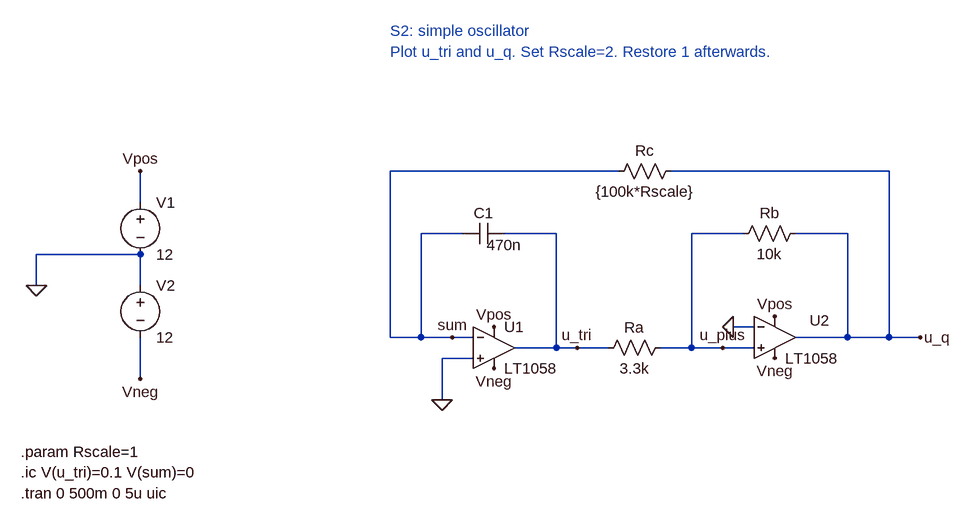
[diagram p0: schematic 6.1_oscillator.asc]
6.1_oscillator.asc, the LTspice schematic file:
Version 4.1
SHEET 1 2020 788
WIRE 768 16 416 16
WIRE 1184 16 848 16
WIRE 32 64 32 16
WIRE 528 112 464 112
WIRE 672 112 592 112
WIRE 960 112 880 112
WIRE 1120 112 1040 112
WIRE 32 144 -128 144
WIRE -128 192 -128 144
WIRE 32 192 32 144
WIRE 976 256 944 256
WIRE 416 272 416 16
WIRE 464 272 464 112
WIRE 464 272 416 272
WIRE 512 272 464 272
WIRE 544 272 512 272
WIRE 1120 272 1120 112
WIRE 1120 272 1040 272
WIRE 1184 272 1184 16
WIRE 1184 272 1120 272
WIRE 1232 272 1184 272
WIRE 672 288 672 112
WIRE 672 288 608 288
WIRE 704 288 672 288
WIRE 752 288 704 288
WIRE 880 288 880 112
WIRE 880 288 832 288
WIRE 928 288 880 288
WIRE 976 288 928 288
WIRE 544 304 496 304
WIRE 32 336 32 272
WIRE 496 368 496 304
FLAG -128 192 0
FLAG 32 16 Vpos
FLAG 32 336 Vneg
FLAG 576 256 Vpos
FLAG 576 320 Vneg
FLAG 496 368 0
FLAG 944 256 0
FLAG 1008 240 Vpos
FLAG 1008 304 Vneg
FLAG 1232 272 u_q
FLAG 704 288 u_tri
FLAG 512 272 sum
FLAG 928 288 u_plus
SYMBOL voltage 32 48 R0
WINDOW 123 0 0 Left 0
WINDOW 39 0 0 Left 0
SYMATTR InstName V1
SYMATTR Value 12
SYMBOL voltage 32 176 R0
SYMATTR InstName V2
SYMATTR Value 12
SYMBOL OpAmps\\LT1058 576 224 R0
SYMATTR InstName U1
SYMBOL OpAmps\\LT1058 1008 208 R0
WINDOW 0 54 38 Left 2
SYMATTR InstName U2
SYMBOL cap 592 96 R90
WINDOW 0 0 32 VBottom 2
WINDOW 3 18 0 VTop 2
SYMATTR InstName C1
SYMATTR Value 470n
SYMBOL res 848 272 R90
WINDOW 0 0 56 VBottom 2
WINDOW 3 32 56 VTop 2
SYMATTR InstName Ra
SYMATTR Value 3.3k
SYMBOL res 1056 96 R90
WINDOW 0 0 56 VBottom 2
WINDOW 3 32 56 VTop 2
SYMATTR InstName Rb
SYMATTR Value 10k
SYMBOL res 864 0 R90
WINDOW 0 0 56 VBottom 2
WINDOW 3 32 56 VTop 2
SYMATTR InstName Rc
SYMATTR Value {100k*Rscale}
TEXT -152 448 Left 2 !.param Rscale=1
TEXT -152 480 Left 2 !.ic V(u_tri)=0.1 V(sum)=0
TEXT -152 512 Left 2 !.tran 0 500m 0 5u uic
TEXT 416 -200 Left 2 ;S2: simple oscillator
TEXT 416 -168 Left 2 ;Plot u_tri and u_q. Set Rscale=2. Restore 1 afterwards.

The netlist it stands for:
* 6.1_oscillator.asc
V1 Vpos 0 12
V2 0 Vneg 12
X§U1 0 sum Vpos Vneg u_tri LT1057  ; LT1058, pins In+ In- V+ V- OUT
X§U2 u_plus 0 Vpos Vneg u_q LT1057  ; LT1058, pins In+ In- V+ V- OUT
C1 u_tri sum 470n
Ra u_plus u_tri 3.3k
Rb u_q u_plus 10k
Rc u_q sum {100k*Rscale}
.param Rscale=1
.ic V(u_tri)=0.1 V(sum)=0
.tran 0 500m 0 5u uic
* S2: simple oscillator
* Plot u_tri and u_q. Set Rscale=2. Restore 1 afterwards.
.lib LTC.lib
.backanno
.end